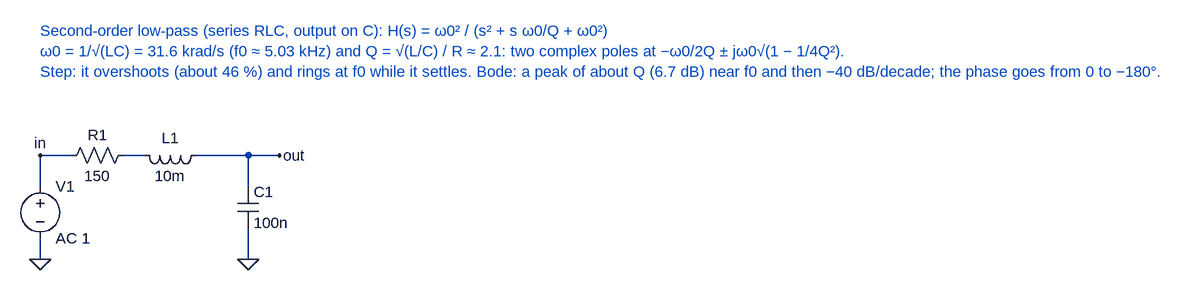
[diagram p0: schematic lp2.asc]
lp2.asc, the LTspice schematic file:
Version 4
SHEET 1 1200 800
WIRE 0 -32 48 -32
WIRE 128 -32 160 -32
WIRE 240 -32 320 -32
WIRE 320 -32 368 -32
WIRE 320 -32 320 16
WIRE 320 80 320 128
WIRE 0 16 0 -32
WIRE 0 96 0 128
FLAG 320 128 0
FLAG 368 -32 out
FLAG 0 128 0
FLAG 0 -32 in
SYMBOL voltage 0 0 R0
SYMATTR InstName V1
SYMATTR Value AC 1
SYMBOL res 144 -48 R90
WINDOW 0 0 56 VBottom 2
WINDOW 3 32 56 VTop 2
SYMATTR InstName R1
SYMATTR Value 150
SYMBOL ind 256 -48 R90
WINDOW 0 5 56 VBottom 2
WINDOW 3 32 56 VTop 2
SYMATTR InstName L1
SYMATTR Value 10m
SYMATTR SpiceLine Rser=0
SYMBOL cap 304 16 R0
SYMATTR InstName C1
SYMATTR Value 100n
TEXT 0 -224 Left 2 ;Second-order low-pass (series RLC, output on C): H(s) = ω0² / (s² + s ω0/Q + ω0²)\nω0 = 1/√(LC) = 31.6 krad/s (f0 ≈ 5.03 kHz) and Q = √(L/C) / R ≈ 2.1: two complex poles at −ω0/2Q ± jω0√(1 − 1/4Q²).\nStep: it overshoots (about 46 %) and rings at f0 while it settles. Bode: a peak of about Q (6.7 dB) near f0 and then −40 dB/decade; the phase goes from 0 to −180°.

The netlist it stands for:
* lp2.asc
V1 in 0 AC 1
R1 N001 in 150
L1 out N001 10m Rser=0
C1 out 0 100n
* Second-order low-pass (series RLC, output on C): H(s) = ω0² / (s² + s ω0/Q + ω0²)
* ω0 = 1/√(LC) = 31.6 krad/s (f0 ≈ 5.03 kHz) and Q = √(L/C) / R ≈ 2.1: two complex poles at −ω0/2Q ± jω0√(1 − 1/4Q²).
* Step: it overshoots (about 46 %) and rings at f0 while it settles. Bode: a peak of about Q (6.7 dB) near f0 and then −40 dB/decade; the phase goes from 0 to −180°.
.backanno
.end